# Altium project Industrial_Test_Rig_Circuit.PrjPcb
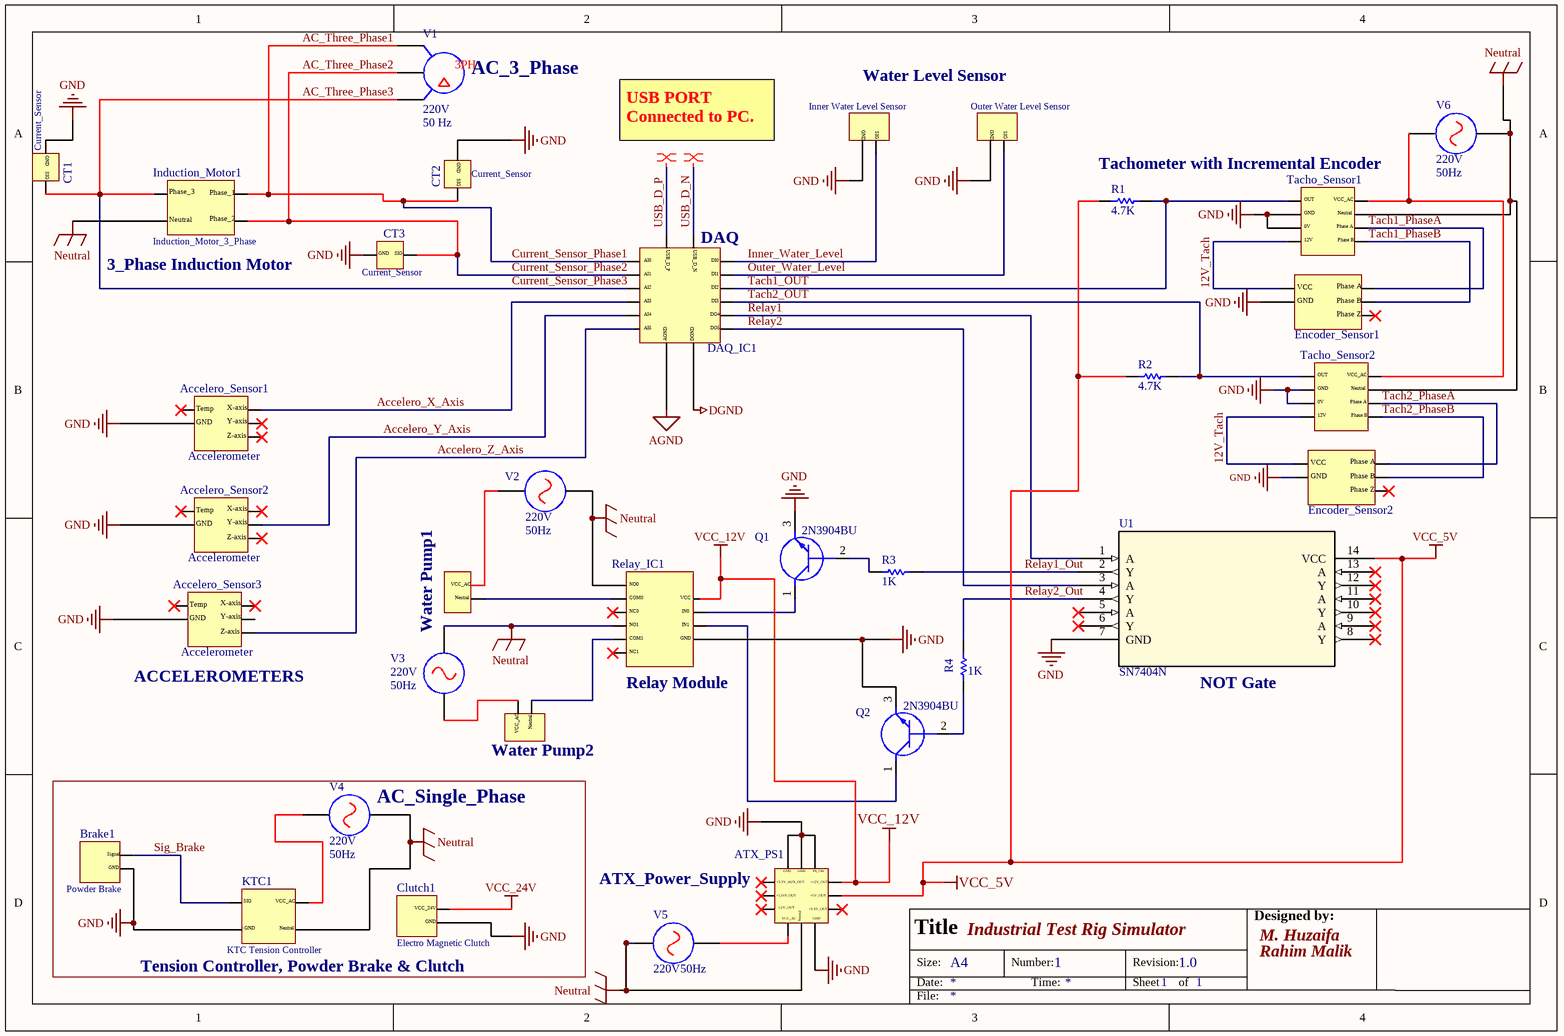
[diagram p0: Hardware_Connection.SchDoc]
1 sheet, 34 parts. Net scope: global (net labels, ports and power ports of the same name join across sheets).

## Sheet Hardware_Connection.SchDoc: Industrial Test Rig Simulator
size A4; DocumentNumber: 1; Revision: 1.0; SheetNumber: 1; SheetTotal: 1

### Parts
Accelero_Sensor1  Accelerometer
Accelero_Sensor2  Accelerometer
Accelero_Sensor3  Accelerometer
ATX_PS1  ATX_Power_Supply  (value not drawn)
Brake1  Powder Brake
Clutch1  Electro Magnetic Clutch
CT1  Current_Sensor
CT2  Current_Sensor
CT3  Current_Sensor
DAQ_IC1  NI USB-6008  (value not drawn)
Encoder_Sensor1  Incremental Encoder  (value not drawn)
Encoder_Sensor2  Incremental Encoder  (value not drawn)
Induction_Motor1  Induction_Motor_3_Phase
Inner_Water_Level_Sensor1  Inner Water Level Sensor
KTC1  KTC Tension Controller
Outer_Water_Level_Sensor1  Outer Water Level Sensor
Q1  2N3904BU  [LM431ACZ]
Q2  2N3904BU  [LM431ACZ]
R1  value 4.7K  (hidden comment: Resistor)
R2  value 4.7K  (hidden comment: Resistor)
R3  value 1K  (hidden comment: Resistor)
R4  value 1K  (hidden comment: Resistor)
Relay_IC1  Relay  (value not drawn)
Tacho_Sensor1  Tachometer  (value not drawn)
Tacho_Sensor2  Tachometer  (value not drawn)
U1  SN7404N  [N14]
V1  V_RMS: 220V  FREQ: 50 Hz  (hidden comment: 3-Phase Delta Voltage Source)
V2  DC: 220V  Freq: 50Hz  (hidden comment: AC Voltage Source)
V3  DC: 220V  Freq: 50Hz  (hidden comment: AC Voltage Source)
V4  DC: 220V  Freq: 50Hz  (hidden comment: AC Voltage Source)
V5  DC: 220V  Freq: 50Hz  (hidden comment: AC Voltage Source)
V6  DC: 220V  Freq: 50Hz  (hidden comment: AC Voltage Source)
Water_Pump1  Water Pump  (value not drawn)
Water_Pump2  Water Pump  (value not drawn)

### Blocks framed on the sheet
AC_Single_Phase: Brake1 Clutch1 KTC1 V4

### Nets
GND: Q1.3(E) Q2.3(E) U1.7(GND)
Neutral: V2.2 V3.2 V4.1 V5.2 V6.2
VCC_5V: R1.1 R2.1 U1.14(VCC)
AC_Three_Phase1: V1.1  [also labelled Current_Sensor_Phase1]
AC_Three_Phase2: V1.2  [also labelled Current_Sensor_Phase2]
AC_Three_Phase3: V1.3  [also labelled Current_Sensor_Phase3]
Relay1: U1.1(A)
Relay1_Out: R3.2 U1.2(Y)
Relay2: U1.3(A)
Relay2_Out: R4.1 U1.4(Y)
Tach1_OUT: R1.2
Tach2_OUT: R2.2
NetQ1_2: Q1.2(B) R3.1
NetQ2_2: Q2.2(B) R4.2

Not connected (* = marked no-connect by the designer): Q1 1(C); Q2 1(C); U1 5(A)* 6(Y)* 8(Y)* 9(A)* 10(Y)* 11(A)* 12(Y)* 13(A)*; V2 1; V3 1; V4 2; V5 1; V6 1

### Layout directives
differential pair: USB_D_N, USB_D_P

### Notes on the sheet
- (near V1) AC_3_Phase
- Water Level Sensor
- USB PORT Connected to PC.
- (near R1) Tachometer with Incremental Encoder
- DAQ
- (near Induction_Motor1) 3_Phase Induction Motor
- Water Pump1
- (near Accelero_Sensor3) ACCELEROMETERS
- (near Relay_IC1) Relay Module
- (near U1) NOT Gate
- (near Water_Pump2) Water Pump2
- ATX_Power_Supply
- Tension Controller, Powder Brake & Clutch
- Labels drawn without touching a wire or pin: GND
- Designed by:
- Title
- Size:
- Date:
- A4
- Number:
- Time:
- Revision:
- Sheet
- of
- M. Huzaifa
- Rahim Malik
- File:
- (in symbol 3 Phase Delta) 3PH
- (in symbol Accelerometer) X-axis; Temp; Y-axis; GND; Z-axis
- (in symbol ATX_Supply) GND; PS_ON; +3.3V_AUX_OUT; +12V_OUT; +12VP_OUT; +5V_OUT; -12V_OUT; +3.3V_OUT; VCC_AC; Neutral
- (in symbol Current_Sensor) GND; SIG
- (in symbol Electro Magneetic Clutch) VCC_24V; GND
- (in symbol Incremental Encoder) Phase A; VCC; GND; Phase B; Phase Z
- (in symbol Induction_Motor_3_Phase) Phase_3; Phase_1; Phase_2; Neutral
- (in symbol KTC Tension Controller) SIG; VCC_AC; GND; Neutral
- (in symbol NI USB-6008) USB_D_P; USB_D_N; AI0; DI0; AI1; DI1; AI2; DI2; AI3; DI3; AI4; DO4; AI5; DO5; AGND; DGND
- (in symbol Powder Brake) Signal; GND
- (in symbol Relay) NO0; COM0; VCC; NC0; IN0; NO1; IN1; COM1; GND; NC1
- (in symbol Tachometer) OUT; VCC_AC; GND; Neutral; 0V; Phase A; 12V; Phase B
- (in symbol Water Level Sensor) GND; SIG
- (in symbol Water Pump) VCC_AC; Neutral

### Library data of the parts
ATX_PS1 = ATX_Supply
Clutch1 = Electro Magneetic Clutch
Inner_Water_Level_Sensor1 Outer_Water_Level_Sensor1 = Water Level Sensor
Q1 Q2 = 2N3904BU: Transistor BJT NPN; Manufacturer_Name: onsemi; Datasheet Link: http://www.onsemi.com/pub/Collateral/2N3904-D.pdf; Height: 5.33mm; Manufacturer_Part_Number: 2N3904BU; Mouser Part Number: 512-2N3904BU; Mouser Price/Stock: https://www.mouser.co.uk/ProductDetail/onsemi-Fairchild/2N3904BU?qs=or4AE2qAS%252Bd0Jdpn%2F8ktKg%3D%3D; Arrow Part Number: 2N3904BU; Arrow Price/Stock: https://www.arrow.com/en/products/2n3904bu/on-semiconductor?region=nac
R1-R4 = Resistor: TC1: 0; SimulationGenericComponent: True; TC2: 0
U1 = SN7404N: No Description Available; Mfr_Name: Texas Instruments; RefDes: RefDes; Type: Type
V1 = 3 Phase Delta: SimulationGenericComponent: True
V2-V6 = AC Voltage Source: SimulationGenericComponent: True; Phase: 0; Amp: 1; Rser: 0; Cpar: 0